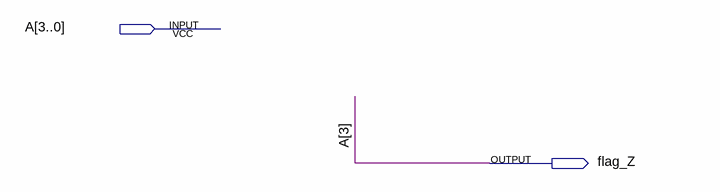
[diagram p0: schematic sheet]
// Quartus schematic flag_neg.bdf as structural Verilog: 0 symbols, 2 pins
module flag_neg (
  input  [3:0] A,
  output flag_Z
);


  assign flag_Z = A[3];
endmodule
